# EasyEDA Pro project 眼球小板_立创文件.epro, board PCB1
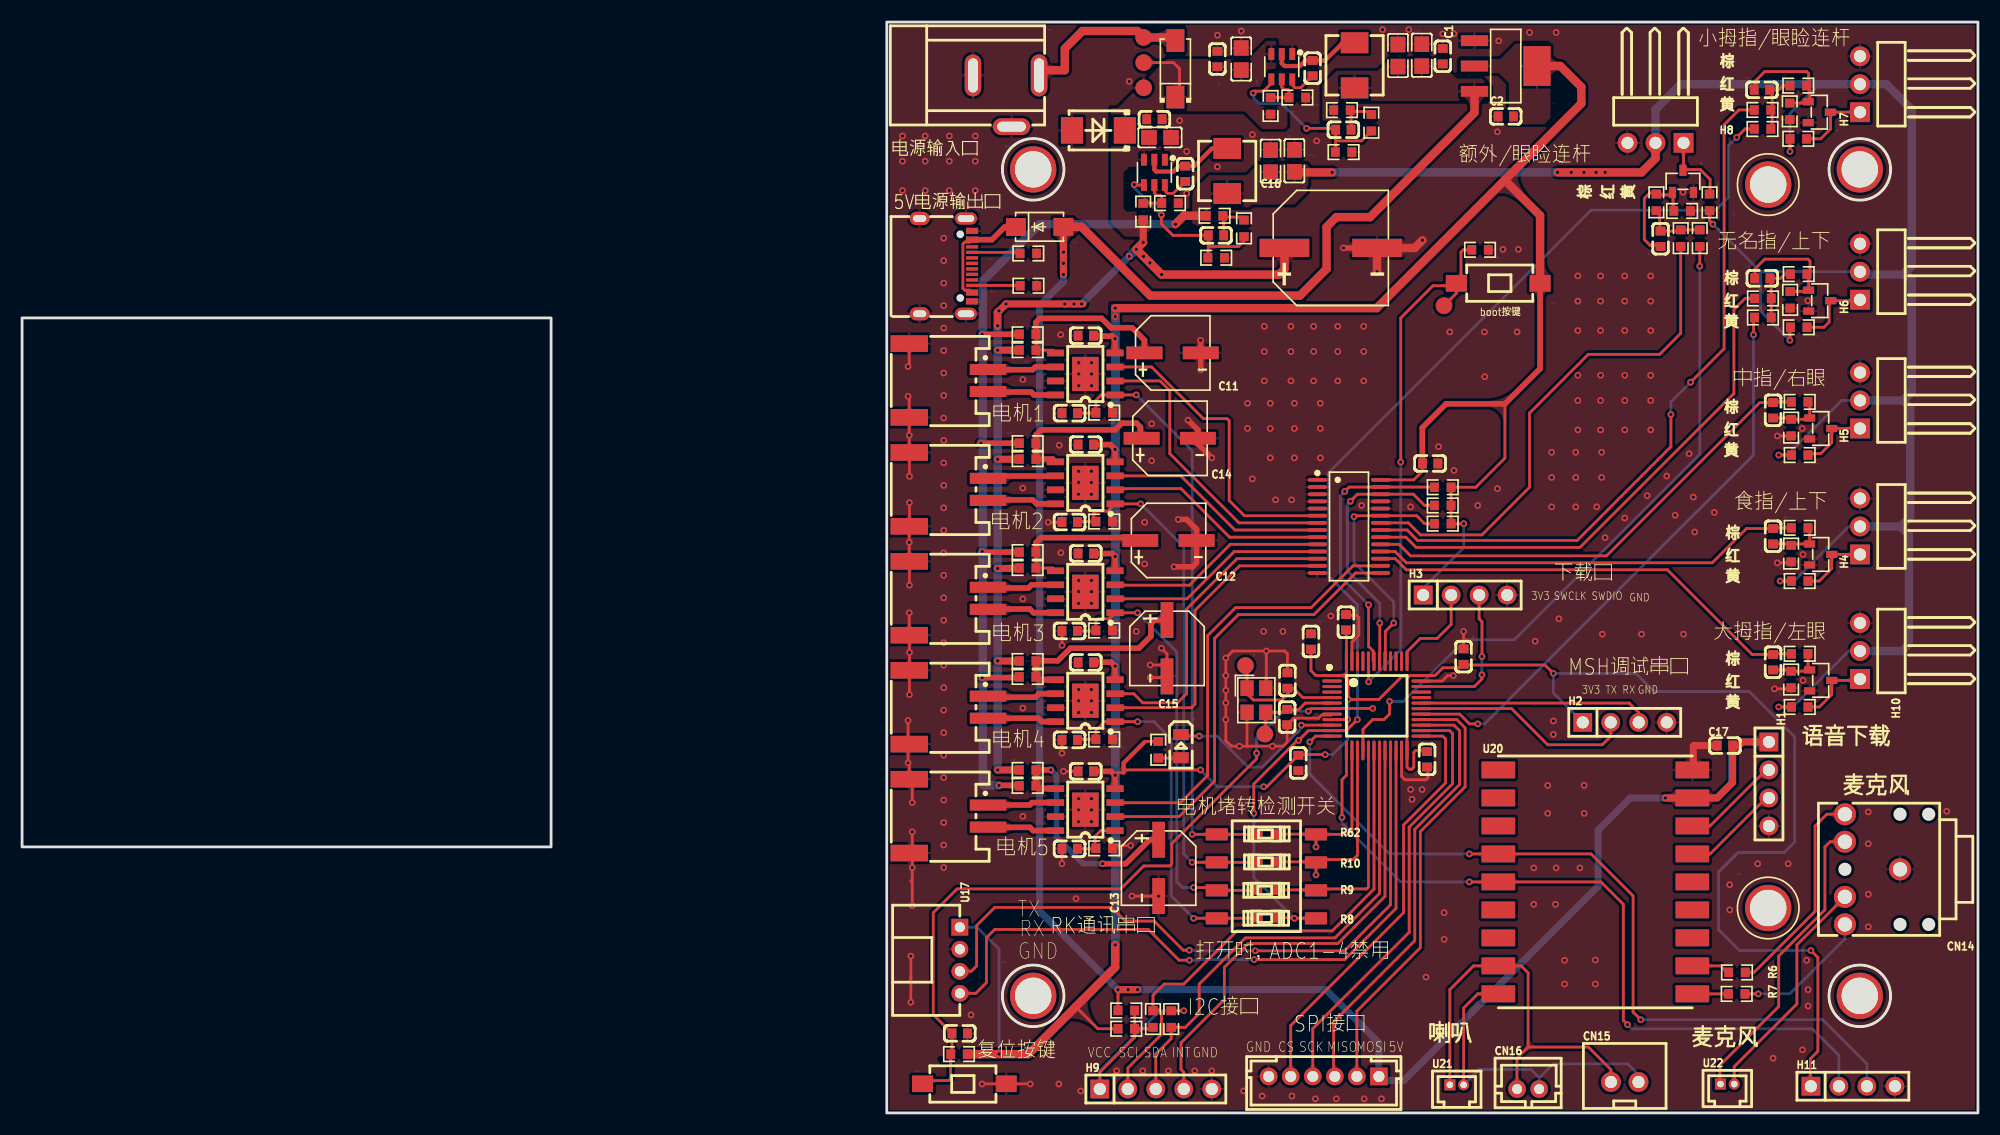
[diagram p5: board, top side]
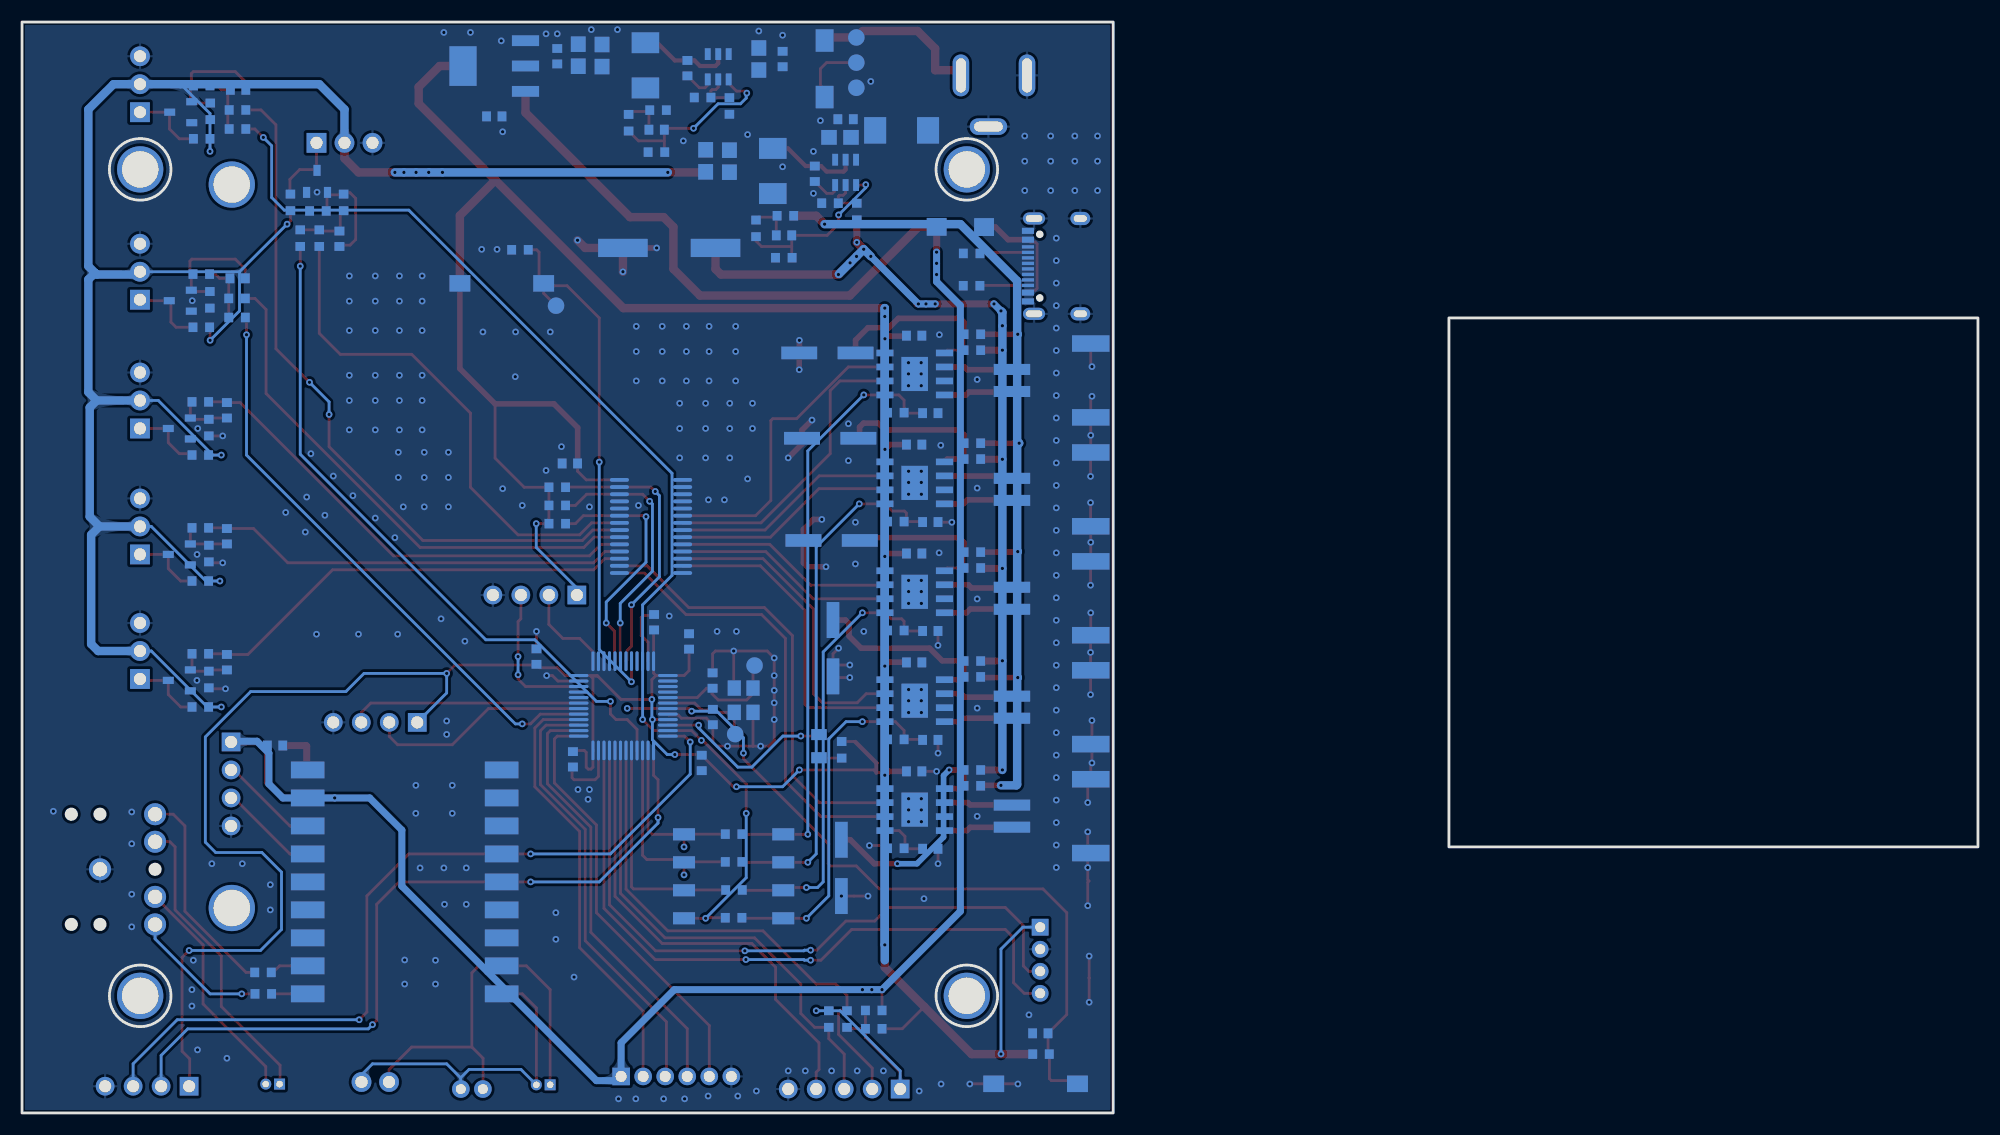
[diagram p6: board, bottom side, seen from below]

Outline 177.46 x 99 mm; copper layers: Top Layer, Bottom Layer. Coordinates in mm from the lower left corner of the outline.
Outline path: rectangle 0,72.15 48,24.15 ; rectangle 78.46,99 177.46,0 ; circle c91.74,85.63 r2.79 ; circle c91.74,10.63 r2.79 ; circle c166.74,85.63 r2.79 ; circle c166.74,10.63 r2.79
Stack: Top Layer 0.035mm / Dielectric1 1.51mm FR4 er 4.5 / Bottom Layer 0.035mm

## Design rules (mm)
spacing copperThickness1oz (default): track to track 0.102, other pairs 0.152 to 0.3
spacing copperThickness2oz: track to track 0.203, other pairs 0.152 to 0.3
track width copperThickness1oz (default): min 0.127, default 0.254, max 2.54
track width copperThickness2oz: min 0.203, default 0.254, max 2.54
differential pair differentialPair (default): width min 0.127, default 0.254, max 2.54; gap min 0.152, default 0.152
net +5V uses copperRegion
net PWM_5V uses copperRegion
net V3.3 uses copperRegion
net VIN uses copperRegion
net GND uses copperRegion

## Placement (name value [footprint] x y rotation side)
C1  10uF  [C0603_1]  128.9 95.9 270 top
C2  10uF  [C0603_1]  134.62 90.44 0 top
C3  100nF  [C0603_1]  102.74 90.18 180 top
C4  100nF  [C0603_1]  105.53 85.23 270 top
C5  100nF  [C0603]  95.05 63.51 0 top
C6  100nF  [C0603]  96.52 70.54 0 top
C7  75pF  [C0603_1]  108.33 79.64 180 top
C8  22uF  [C0805]  115.44 86.41 270 top
C9  22uF  [C0805]  113.28 86.37 270 top
C10  22uF  [C0805]  103.25 88.53 180 top
C11  100uF  [CAP-SMD_BD6.3-L6.6-W6.6-RD]  104.39 68.97 180 top
C12  100uF  [CAP-SMD_BD6.3-L6.6-W6.6-RD]  104.01 51.96 180 top
C13  100uF  [CAP-SMD_BD6.3-L6.6-W6.6-RD]  103.12 22.24 90 top
C14  100uF  [CAP-SMD_BD6.3-L6.6-W6.6-RD]  104.14 61.23 180 top
C15  100uF  [CAP-SMD_BD6.3-L6.6-W6.6-RD]  103.88 42.18 90 top
C16  470uF  [CAP-SMD_BD10.0-L10.3-W10.3-LS11.0]  118.74 78.5 0 top
C17  4.7uF  [C0603_1]  154.5 33.34 180 top
C19  100nF  [C0603]  95.05 53.62 0 top
C20  100nF  [C0603]  96.52 60.65 0 top
C21  100nF  [C0603]  95.05 43.74 0 top
C22  100nF  [C0603]  96.52 50.77 0 top
C23  100nF  [C0603]  95.05 33.86 0 top
C24  100nF  [C0603]  96.52 40.88 0 top
C25  100nF  [C0603]  95.05 23.97 0 top
C26  100nF  [C0603]  96.52 31 0 top
C27  100nF  [C0603_1]  127.48 32.09 90 top
C28  100nF  [C0603_1]  115.8 31.76 90 top
C29  100nF  [C0603_1]  116.94 42.79 270 top
C30  100nF  [C0603_1]  130.79 41.41 270 top
C31  100nF  [C0603_1]  120.12 44.53 270 top
C32  100nF  [C0603]  85.07 7.23 180 top
C33  22pF  [C0603_1]  114.81 39.24 90 top
C34  22pF  [C0603_1]  114.78 35.93 270 top
C36  100nF  [C0603]  127.76 58.94 0 top
C37  33pF  [C0603_1]  158.87 40.91 90 top
C38  33pF  [C0603_1]  158.87 52.34 90 top
C39  33pF  [C0603_1]  158.87 63.77 90 top
C40  33pF  [C0603_1]  157.9 75.74 0 top
C41  33pF  [C0603_1]  157.86 92.85 0 top
C42  33pF  [C0603_1]  148.66 79.33 90 top
C82  100nF  [C0603_1]  117.09 94.82 270 top
C83  22uF  [C0805]  110.61 95.64 270 top
C84  100nF  [C0603_1]  108.45 95.64 270 top
C87  22uF  [C0805]  124.84 95.96 270 top
C113  22uF  [C0805]  127 95.99 270 top
C114  75pF  [C0603_1]  119.89 89.23 180 top
CN1  HCZZ0383-2  [CONN-SMD_2P-P2.00_HCZZ0383-2]  84.07 46.7 270 top
CN3  HCZZ0383-2  [CONN-SMD_2P-P2.00_HCZZ0383-2]  84.07 26.94 270 top
CN4  HCZZ0383-2  [CONN-SMD_2P-P2.00_HCZZ0383-2]  84.07 56.59 270 top
CN5  HCZZ0383-2  [CONN-SMD_2P-P2.00_HCZZ0383-2]  84.07 36.82 270 top
CN11  HCZZ0383-2  [CONN-SMD_2P-P2.00_HCZZ0383-2]  84.07 66.47 270 top
CN14  PJ-307N5  [AUDIO-TH_PJ-307N5]  167.89 22.11 180 top
CN15  AXH-2A-11  [CONN-TH_KH-XH-2A-Z]  145.41 2.81 0 top
CN16  B2B-PH-K-S(LF)(SN)  [CONN-TH_B2B-PH-K-S]  136.65 2.17 0 top
D3  SMBJ36A  [SMB_L4.4-W3.6-LS5.3-RD]  97.66 89.17 180 top
D4  B260A-13-F  [SMA_L4.4-W2.8-LS5.4-RD]  104.64 94.75 90 top
D5  NCD0805G1  [LED0805-R-RD]  105.15 33.29 270 top
D6  SS34  [SMA_L4.3-W2.6-LS5.0-FD]  92.33 80.4 180 top
DC1  DC-005-A200  [DC-IN-TH_DC-005-A200]  89.28 91.83 0 top
H1  PZ254V-11-04P  [HDR-TH_4P-P2.54-V-M]  158.49 29.86 270 top
H2  PZ254V-11-04P  [HDR-TH_4P-P2.54-V-M]  145.41 35.45 0 top
H3  PZ254V-11-04P  [HDR-TH_4P-P2.54-V-M]  130.93 47 0 top
H4  PZ254R-11-03P  [HDR-TH_3P-P2.54-H-M-W10.4]  166.76 53.23 90 top
H5  PZ254R-11-03P  [HDR-TH_3P-P2.54-H-M-W10.4]  166.76 64.66 90 top
H6  PZ254R-11-03P  [HDR-TH_3P-P2.54-H-M-W10.4]  166.76 76.34 90 top
H7  PZ254R-11-03P  [HDR-TH_3P-P2.54-H-M-W10.4]  166.76 93.36 90 top
H8  PZ254R-11-03P  [HDR-TH_3P-P2.54-H-M-W10.4]  148.21 88.04 180 top
H9  PZ254V-11-05P  [HDR-TH_5P-P2.54-V-M]  102.87 2.17 0 top
H10  PZ254R-11-03P  [HDR-TH_3P-P2.54-H-M-W10.4]  166.76 41.92 90 top
H11  PZ254V-11-04P  [HDR-TH_4P-P2.54-V-M]  166.11 2.43 0 top
L1  10uH  [IND-SMD_L5.4-W5.2_FXL0530]  109.34 85.48 90 top
L9  10uH  [IND-SMD_L5.4-W5.2_FXL0530]  120.9 95.07 90 top
Q1  MMBT3904  [SOT-23-3_L2.9-W1.3-P1.90-LS2.4-BR]  163.19 39.26 180 top
Q2  MMBT3904  [SOT-23-3_L2.9-W1.3-P1.90-LS2.4-BR]  163.19 50.69 180 top
Q3  MMBT3904  [SOT-23-3_L2.9-W1.3-P1.90-LS2.4-BR]  163.19 62.12 180 top
Q4  MMBT3904  [SOT-23-3_L2.9-W1.3-P1.90-LS2.4-BR]  163.1 73.71 180 top
Q5  MMBT3904  [SOT-23-3_L2.9-W1.3-P1.90-LS2.4-BR]  163.06 90.82 180 top
Q6  MMBT3904  [SOT-23-3_L2.9-W1.3-P1.90-LS2.4-BR]  150.7 84.54 270 top
R1  100kΩ  [R0603_1]  110.87 80.28 90 top
R2  50Ω  [R0603_1]  108.2 81.42 180 top
R3  13.3kΩ  [R0603_1]  108.35 77.61 180 top
R4  511kΩ  [R0603_1]  101.72 81.8 270 top
R5  105kΩ  [R0603_1]  104.15 82.56 180 top
R6  0Ω  [R0603_1]  155.6 12.76 0 top
R7  0Ω  [R0603_1]  155.57 10.81 0 top
R8  0Ω  [R0603_1]  112.9 17.72 180 top
R9  0Ω  [R0603_1]  112.87 20.24 180 top
R10  0Ω  [R0603_1]  112.9 22.79 180 top
R11  2.1kΩ  [R0603_1]  98.19 63.55 180 top
R12  2.1kΩ  [R0603_1]  98.19 53.67 180 top
R13  2.1kΩ  [R0603_1]  98.19 43.78 180 top
R14  2.1kΩ  [R0603_1]  98.19 33.9 180 top
R15  2.1kΩ  [R0603_1]  98.19 24.02 180 top
R16  0Ω  [R0603_1]  91.24 70.66 0 top
R17  0Ω  [R0603_1]  91.24 69.22 0 top
R18  0Ω  [R0603_1]  91.24 60.78 0 top
R19  0Ω  [R0603_1]  91.24 59.34 0 top
R20  0Ω  [R0603_1]  91.24 50.9 0 top
R21  0Ω  [R0603_1]  91.24 49.45 0 top
R22  0Ω  [R0603_1]  91.24 39.57 0 top
R23  0Ω  [R0603_1]  91.24 41.01 0 top
R24  0Ω  [R0603_1]  91.24 29.69 0 top
R25  0Ω  [R0603_1]  91.24 31.13 0 top
R26  10kΩ  [R0603]  132.28 78.33 180 top
R27  10kΩ  [R0603]  85.01 5.34 180 top
R28  200Ω  [R0603_1]  103.1 32.96 90 top
R29  4.7kΩ  [R0603_1]  128.9 56.78 180 top
R30  4.7kΩ  [R0603_1]  128.9 55.13 180 top
R31  10kΩ  [R0603_1]  128.9 53.48 0 top
R32  1kΩ  [R0603_1]  161.29 41.67 0 top
R33  4.7kΩ  [R0603_1]  160.51 39.33 90 top
R34  4.7kΩ  [R0603_1]  161.29 36.84 180 top
R35  1kΩ  [R0603_1]  161.29 53.1 0 top
R36  4.7kΩ  [R0603_1]  160.51 50.77 90 top
R37  4.7kΩ  [R0603_1]  161.29 48.27 180 top
R38  1kΩ  [R0603_1]  161.29 64.53 0 top
R39  4.7kΩ  [R0603_1]  160.51 62.19 90 top
R40  4.7kΩ  [R0603_1]  161.29 59.7 180 top
R41  1kΩ  [R0603_1]  161.2 76.12 0 top
R42  4.7kΩ  [R0603_1]  160.42 73.79 90 top
R43  4.7kΩ  [R0603_1]  161.2 71.3 180 top
R44  1kΩ  [R0603_1]  161.16 93.23 0 top
R45  4.7kΩ  [R0603_1]  160.38 90.9 90 top
R46  4.7kΩ  [R0603_1]  161.16 88.41 180 top
R47  1kΩ  [R0603_1]  148.28 82.63 90 top
R48  4.7kΩ  [R0603_1]  150.62 81.86 180 top
R49  4.7kΩ  [R0603_1]  153.11 82.63 270 top
R50  0Ω  [R0603_1]  150.49 79.39 270 top
R51  0Ω  [R0603]  152.22 79.39 270 top
R52  0Ω  [R0603_1]  100.19 7.64 180 top
R53  0Ω  [R0603_1]  100.19 9.3 180 top
R54  0Ω  [R0603_1]  157.91 91.02 180 top
R55  0Ω  [R0603]  157.91 89.29 180 top
R56  0Ω  [R0603_1]  157.95 73.92 180 top
R57  0Ω  [R0603]  157.95 72.19 180 top
R58  4.7kΩ  [R0603_1]  102.61 8.52 270 top
R59  4.7kΩ  [R0603_1]  104.26 8.52 90 top
R60  5.1kΩ  [R0603_1]  91.3 78 0 top
R61  5.1kΩ  [R0603_1]  91.31 75.07 0 top
R62  0Ω  [R0603_1]  112.9 25.3 180 top
R137  511kΩ  [R0603_1]  113.28 91.39 270 top
R138  105kΩ  [R0603_1]  115.71 92.15 180 top
R139  100kΩ  [R0603_1]  122.42 89.86 90 top
R140  13.3kΩ  [R0603_1]  119.9 87.2 180 top
R141  50Ω  [R0603_1]  119.76 91.01 180 top
SW1  TS-1101-C-W  [SW-SMD_L6.0-W3.3-LS8.0]  133.94 75.28 180 top
SW2  TS-1101-C-W  [SW-SMD_L6.0-W3.3-LS8.0]  85.5 2.65 0 top
SW3  2.54-4P TPGT  [SW-SMD_8P-L10.2-W6.2-P2.54-LS9.4]  112.9 21.48 180 top
TP1  -  [Test-Point-1.5mm]  101.77 95.32 0 top
TP2  -  [Test-Point-1.5mm]  101.77 93.04 0 top
TP4  -  [Test-Point-1.5mm]  101.77 97.6 0 top
TP7  -  [Test-Point-1.5mm]  129.01 73.26 90 top
TP9  -  [Test-Point-1.5mm]  111 40.6 270 top
TP10  -  [Test-Point-1.5mm]  112.76 34.38 270 top
U1  DRV8251ADDAR  [SOPOWERPAD-8_L4.9-W3.9-P1.27-LS6.0-TL-EP]  96.47 57.18 180 top
U2  TPS54302DDCR  [SOT-23-6_L2.9-W1.6-P0.95-LS2.8-BL]  102.74 85.36 180 top
U3  DRV8251ADDAR  [SOPOWERPAD-8_L4.9-W3.9-P1.27-LS6.0-TL-EP]  96.47 47.3 180 top
U4  DRV8251ADDAR  [SOPOWERPAD-8_L4.9-W3.9-P1.27-LS6.0-TL-EP]  96.47 67.06 180 top
U5  DRV8251ADDAR  [SOPOWERPAD-8_L4.9-W3.9-P1.27-LS6.0-TL-EP]  96.47 37.41 180 top
U6  DRV8251ADDAR  [SOPOWERPAD-8_L4.9-W3.9-P1.27-LS6.0-TL-EP]  96.47 27.53 180 top
U7  GD32F103C8T6  [TQFP-48_L7.0-W7.0-P0.50-LS9.0-BL]  122.91 36.95 270 top
U8  PCA9685PW/Q900,118  [TSSOP-28_L9.7-W4.4-P0.65-LS6.4-BL]  120.39 53.23 270 top
U9  M3*12+3  [TH_BD4.7-D3.0]  158.43 84.25 90 top
U10  M3*12+3  [TH_BD4.7-D3.0]  158.43 18.6 0 top
U11  WAFER-PH2.0-6PZZ  [CONN-TH_6P-P2.00_PH2.0-6P]  118.11 3.31 0 top
U12  M3*12+3  [TH_BD4.7-D3.0]  91.74 85.63 0 top
U13  M3*12+3  [TH_BD4.7-D3.0]  166.74 85.63 0 top
U14  M3*12+3  [TH_BD4.7-D3.0]  91.74 10.63 0 top
U15  M3*12+3  [TH_BD4.7-D3.0]  166.74 10.63 0 top
U16  CJT1117B-3.3  [SOT-223-4_L6.5-W3.5-P2.30-LS7.0-BR]  134.62 95.01 180 top
U17  WAFER-PH2.0-4PWZ  [CONN-TH_4P-P2.00_BX-PH2.0-4PWZ]  85.09 13.86 270 top
U20  957dd1498d12ea03  [ASRPRO邮票孔]  142.62 20.97 0 top
U21  ZX-MX1.25-2PZZ  [CONN-TH_2P-P1.25_MEGASTAR_ZX-MX1.25-2PZZ]  130.17 2.55 0 top
U22  ZX-MX1.25-2PZZ  [CONN-TH_2P-P1.25_MEGASTAR_ZX-MX1.25-2PZZ]  154.72 2.62 0 top
U28  TPS54302DDCR  [SOT-23-6_L2.9-W1.6-P0.95-LS2.8-BL]  114.3 94.94 180 top
USB1  TYPE-C 16PIN 2MD(073)  [USB-C-SMD_TYPE-C-16PIN-2MD-073]  83.82 76.85 270 top
X1  8MHz  [CRYSTAL-SMD_4P-L3.2-W2.5-BL]  111.99 37.45 270 top

## Footprints (pads in the part's own frame, mm; a bottom-side part is the same pattern mirrored in y, then rotated)
ASRPRO邮票孔
  rect 3.048x1.524 hole 0.001: 1(-8.673,10.16) 2(-8.673,7.62) 3(-8.673,5.08) 4(-8.673,2.54) 5(-8.673,0) 6(-8.673,-2.54) 7(-8.673,-5.08) 8(-8.673,-7.62) 9(-8.673,-10.16) 10(8.927,-10.159) 11(8.927,-7.62) 12(8.927,-5.08) 13(8.927,-2.539) 14(8.927,0.001) 15(8.927,2.541) 16(8.927,5.08) 17(8.927,7.62) 18(8.927,10.161)
AUDIO-TH_PJ-307N5
  round 2 hole 1.3: 1(-2.5,0) 2(2.5,-5) 3(2.5,5) 4(2.5,-2.5) 5(2.5,2.5)
C0603
  rect 0.8x0.9 hole 0.001: 1(-0.7,0) 2(0.7,0)
C0603_1
  rect 0.8x0.9 hole 0.001: 1(-0.7,0) 2(0.7,0)
C0805
  rect 1.41x1.35 hole 0.001: 1(-1,0) 2(1,0)
CAP-SMD_BD6.3-L6.6-W6.6-RD
  rect 3.26x1.15 hole 0.001: 1(2.555,0) 2(-2.555,0)
CAP-SMD_BD10.0-L10.3-W10.3-LS11.0
  rect 4.5x1.65 hole 0.001: 1(-4.2,0) 2(4.2,0)
CONN-SMD_2P-P2.00_HCZZ0383-2
  rect 1x3.3 hole 0.001: 1(-1,3.575) 2(1,3.575)
  rect 1.5x3.4 hole 0.001: 3(3.35,-3.575) 4(-3.35,-3.575)
CONN-TH_2P-P1.25_MEGASTAR_ZX-MX1.25-2PZZ
  rect 1x1 hole 0.6: 1(-0.625,0)
  round 1 hole 0.6: 2(0.625,0)
CONN-TH_4P-P2.00_BX-PH2.0-4PWZ
  rect 1.524x1.524 hole 0.914: 1(-3,0)
  round 1.524 hole 0.914: 2(-1,0) 3(1,0) 4(3,0)
CONN-TH_6P-P2.00_PH2.0-6P
  rect 1.6x1.6 hole 1: 1(5,0)
  round 1.6 hole 1: 2(3,0) 3(1,0) 4(-1,0) 5(-3,0) 6(-5,0)
CONN-TH_B2B-PH-K-S
  round 1.6 hole 0.9: 1(1,0) 2(-1,0)
CONN-TH_KH-XH-2A-Z
  round 1.8 hole 1.1: 1(-1.25,0) 2(1.25,0)
CRYSTAL-SMD_4P-L3.2-W2.5-BL
  rect 1.4x1.2 hole 0.001: 1(-1.1,-0.85) 2(1.1,-0.85) 3(1.1,0.85) 4(-1.1,0.85)
DC-IN-TH_DC-005-A200
  oval 1.5x3.8 hole 0.9x3.1: 1(3,2.325) 2(-3,2.325)
  oval 3.4x1.5 hole 2.6x0.9: 3(0.5,-2.325)
HDR-TH_3P-P2.54-H-M-W10.4
  rect 1.8x1.8 hole 1.1: 1(-2.54,0)
  round 1.8 hole 1.1: 2(0,0) 3(2.54,0)
HDR-TH_4P-P2.54-V-M
  rect 1.7x1.7 hole 1.1: 1(-3.81,0)
  round 1.7 hole 1.1: 2(-1.27,0) 3(1.27,0) 4(3.81,0)
HDR-TH_5P-P2.54-V-M
  rect 1.7x1.7 hole 1.1: 1(-5.08,0)
  round 1.7 hole 1.1: 2(-2.54,0) 3(0,0) 4(2.54,0) 5(5.08,0)
IND-SMD_L5.4-W5.2_FXL0530
  rect 1.9x2.5 hole 0.001: 1(-2.05,0) 2(2.05,0)
LED0805-R-RD
  rect 1x1.399 hole 0.001: 1(1.05,0) 2(-1.05,0)
R0603
  rect 0.806x0.864 hole 0.001: 1(-0.753,0) 2(0.753,0)
R0603_1
  rect 0.806x0.864 hole 0.001: 1(-0.753,0) 2(0.753,0)
SMA_L4.3-W2.6-LS5.0-FD
  rect 1.8x1.62 hole 0.001: 1(-2.15,-0.009) 2(2.15,0.009)
SMA_L4.4-W2.8-LS5.4-RD
  rect 2.046x1.62 hole 0.001: 1(-2.566,0) 2(2.566,0)
SMB_L4.4-W3.6-LS5.3-RD
  rect 2x2.4 hole 0.001: 1(-2.4,0) 2(2.4,0)
SOPOWERPAD-8_L4.9-W3.9-P1.27-LS6.0-TL-EP
  rect 1.55x0.6 hole 0.001: 1(-2.7,1.905) 2(-2.7,0.635) 3(-2.7,-0.635) 4(-2.7,-1.905) 5(2.7,-1.905) 6(2.7,-0.635) 7(2.7,0.635) 8(2.7,1.905)
  rect 2.41x3.1 hole 0.001: 9(0,0)
SOT-23-3_L2.9-W1.3-P1.90-LS2.4-BR
  rect 1x0.65 hole 0.001: 1(1,-0.95) 2(1,0.95) 3(-1,0)
SOT-23-6_L2.9-W1.6-P0.95-LS2.8-BL
  rect 0.532x1.072 hole 0.001: 1(-0.95,-1.149) 2(0,-1.149) 3(0.95,-1.149) 4(0.95,1.149) 5(0,1.149) 6(-0.95,1.149)
SOT-223-4_L6.5-W3.5-P2.30-LS7.0-BR
  rect 2.47x0.98 hole 0.001: 1(2.835,-2.3) 2(2.835,0) 3(2.835,2.3)
  rect 2.47x3.6 hole 0.001: 4(-2.835,0)
SW-SMD_8P-L10.2-W6.2-P2.54-LS9.4
  rect 2x1.1 hole 0.001: 1(-4.5,3.81) 2(-4.5,1.27) 3(-4.5,-1.27) 4(-4.5,-3.81) 5(4.5,-3.81) 6(4.5,-1.27) 7(4.5,1.27) 8(4.5,3.81)
SW-SMD_L6.0-W3.3-LS8.0
  rect 1.9x1.5 hole 0.001: 1(-3.8,0) 2(3.8,0)
Test-Point-1.5mm
  round 1.5 hole 0.001: 1(0,0)
TH_BD4.7-D3.0
  round 4.2 hole 3.3: 1(0,0)
TQFP-48_L7.0-W7.0-P0.50-LS9.0-BL
  oval 0.28x1.8 hole 0.001: 1(-2.75,-4.05) 2(-2.25,-4.05) 3(-1.75,-4.05) 4(-1.25,-4.05) 5(-0.75,-4.05) 6(-0.25,-4.05) 7(0.25,-4.05) 8(0.75,-4.05) 9(1.25,-4.05) 10(1.75,-4.05) 11(2.25,-4.05) 12(2.75,-4.05) 25(2.75,4.05) 26(2.25,4.05) 27(1.75,4.05) 28(1.25,4.05) 29(0.75,4.05) 30(0.25,4.05) 31(-0.25,4.05) 32(-0.75,4.05) 33(-1.25,4.05) 34(-1.75,4.05) 35(-2.25,4.05) 36(-2.75,4.05)
  oval 1.8x0.28 hole 0.001: 13(4.05,-2.75) 14(4.05,-2.25) 15(4.05,-1.75) 16(4.05,-1.25) 17(4.05,-0.75) 18(4.05,-0.25) 19(4.05,0.25) 20(4.05,0.75) 21(4.05,1.25) 22(4.05,1.75) 23(4.05,2.25) 24(4.05,2.75) 37(-4.05,2.75) 38(-4.05,2.25) 39(-4.05,1.75) 40(-4.05,1.25) 41(-4.05,0.75) 42(-4.05,0.25) 43(-4.05,-0.25) 44(-4.05,-0.75) 45(-4.05,-1.25) 46(-4.05,-1.75) 47(-4.05,-2.25) 48(-4.05,-2.75)
TSSOP-28_L9.7-W4.4-P0.65-LS6.4-BL
  oval 0.343x1.732 hole 0.001: 1(-4.225,-2.866) 2(-3.575,-2.866) 3(-2.925,-2.866) 4(-2.275,-2.866) 5(-1.625,-2.866) 6(-0.975,-2.866) 7(-0.325,-2.866) 8(0.325,-2.866) 9(0.975,-2.866) 10(1.625,-2.866) 11(2.275,-2.866) 12(2.925,-2.866) 13(3.575,-2.866) 14(4.225,-2.866) 15(4.225,2.866) 16(3.575,2.866) 17(2.925,2.866) 18(2.275,2.866) 19(1.625,2.866) 20(0.975,2.866) 21(0.325,2.866) 22(-0.325,2.866) 23(-0.975,2.866) 24(-1.625,2.866) 25(-2.275,2.866) 26(-2.925,2.866) 27(-3.575,2.866) 28(-4.225,2.866)
USB-C-SMD_TYPE-C-16PIN-2MD-073
  oval 1.1x2 hole 0.6x1.5: 13(-4.325,1.825) 14(4.325,1.825)
  oval 1.2x1.8 hole 0.6x1.2: 13(-4.325,-2.375) 14(4.325,-2.375)
  rect 0.55x1.1 hole 0.001: A1B12(-3.2,2.375) A4B9(-2.4,2.375) B1A12(3.2,2.375) B4A9(2.4,2.375)
  rect 0.3x1.1 hole 0.001: A5(-1.25,2.375) A6(-0.25,2.375) A7(0.25,2.375) A8(1.25,2.375) B5(1.75,2.375) B6(0.75,2.375) B7(-0.75,2.375) B8(-1.75,2.375)

## Nets
As in the schematic.

Pads without a net: U7 2 3 4 32 33 38 39 40 45 46; U9 1; U10 1; U12 1; U13 1; U14 1; U15 1; U20 1 2 3 6 7 12 13 14; USB1 A6 A7 A8 B6 B7 B8

## Via types
v1: diameter 0.61, hole 0.305, Top Layer to Bottom Layer, 414 vias

## Routing (per net, layer and track width the routed paths; a pad name or vN(x,y) marks a point on that pad's centre or on a via; arc(x,y) is an arc through that point)
+5V: length 224.8
  Top Layer w0.254: R53.2 v1(99.44,11.19)
  Top Layer w0.635: H1.1 156.08,33.67 155.75,33.34 C17.1 155.2,30 153.79,28.59 U20.17 v1(149.1,28.59) ; v1(94.48,76.09) v1(94.48,77.1) v1(94.48,78.12) 94.48,78.13 D6.1 ; v1(101.22,11.19) v1(100.36,11.19) v1(99.44,11.19)
  Top Layer w0.762: D6.1 96.13,80.41 102.36,74.18 115.95,74.18 118.36,76.59 118.36,80.4 119.25,81.29 122.3,81.29 131.78,90.78 U16.3
  Bottom Layer w0.635: H1.1 158.43,33.74 156.15,33.74 155.06,32.65 155.06,29.86 153.79,28.59 v1(149.1,28.59) 145.92,28.59 143,25.67 143,20.59 125.35,2.93 123.49,2.93 U11.1 123.11,6.36 118.28,11.19 v1(101.22,11.19) v1(100.36,11.19) v1(99.44,11.19) 92.33,18.3 92.33,73.28 94.48,75.44 v1(94.48,76.09) v1(94.48,77.1) v1(94.48,78.12)
GND: length 146.3
  Top Layer w0.254: C21.1 94.36,43.74 v1(94.36,42.43) ; R33.1 160.42,38.49 v1(159,38.49) ; C27.1 127.56,31.31 127.56,30.42 127.38,30.24 125.47,30.24 125.16,30.55 U7.23 ; 103.88,40.65 103.88,41.67 v1(103.37,42.18) ; 103.88,40.65 v1(102.36,40.65) ; 103.88,40.65 C15.2 103.77,39.51 v1(102.36,39.51) ; C33.2 114.8,39.95 114.8,41.67 114.55,41.92 v1(112.89,41.92) ; v1(112.89,41.92) 109.85,41.92 v1(109.22,41.29) v1(109.22,39.69) v1(109.22,38.35) v1(109.22,37.22) v1(109.22,35.7) 109.22,33.8 109.73,33.29 v1(110.45,33.29) 111.14,33.29 ; v1(112.89,41.92) 112.89,38.61 X1.4 ; v1(80.39,67.73) 80.5,67.84 CN11.4 ; v1(80.52,47.89) 80.52,50.04 CN1.4 v1(80.5,51.79) CN4.3 80.52,53.26 v1(80.52,55.38) ; v1(80.39,65.04) 80.5,64.93 CN11.3 v1(80.5,61.5) CN4.4 80.52,59.92 v1(80.52,57.77) ; v1(80.39,35.62) 80.39,33.58 CN5.3 80.39,33.36 v1(80.39,31.76) 80.5,31.66 CN3.4 80.77,30.01 v1(80.77,28.17) ; C25.1 v1(94.35,22.62) ; U7.8 118.78,36.12 117.93,36.12 117.64,35.83 115.38,35.83 C34.2 114.78,33.65 114.42,33.29 v1(113.46,33.29) 111.14,33.29 ; v1(80.52,37.96) 80.52,40.15 CN5.4 80.52,40.19 v1(80.52,41.8) 80.52,43.34 CN1.3 v1(80.5,45.39) ; v1(91.47,2.63) 91.45,2.65 SW2.2 87.12,2.65 v1(87.11,2.63) ; C31.1 120.2,45.15 121.1,45.15 121.28,44.97 121.28,43.34 120.66,42.72 U7.47 ; v1(93.1,53.61) 94.34,53.61 C19.1 ; v1(100.58,24.27) 99.19,24.27 R15.1 ; 111.14,33.29 111.14,33.29 X1.2 ; R39.1 v1(159.25,61.44) ; U7.35 128.84,39.2 129.33,39.69 v1(129.87,39.69) ; v1(80.64,14.24) 80.64,12.26 80.65,12.25 80.64,12.24 v1(80.64,10.05) ; v1(80.77,25.51) 80.77,23.86 80.5,23.59 80.77,23.31 v1(80.77,22.27) 80.77,21.17 80.65,21.05 80.77,20.93 v1(80.77,18.81) ; C30.1 v1(130.79,43.7) ; v1(159.25,49.92) 160.42,49.92 R36.1 ; v1(100.71,19.68) v1(103.12,19.68) ; C26.1 v1(94.48,31) ; C23.1 v1(94.35,32.65)
  Top Layer w0.508: v1(104.9,53.86) 105.66,53.86 106.57,52.96 C12.2 106.57,49.92 106.21,49.56 v1(104.52,49.56) ; v1(105.79,62.88) 106.69,61.97 C14.2 106.69,60.7 v1(107.95,59.45) ; v1(106.93,70.12) 106.93,68.99 C11.2 v1(106.95,67.45) ; C16.2 v1(119.89,78.5)
  Top Layer w0.635: U20.18 151.63,31.22 151.63,33.29 151.69,33.34 C17.2
  Top Layer w0.762: v1(122.94,76.34) C16.2 126.36,78.5 v1(127.06,79.2)
  vias: v1(79.88,88.66) v1(79.88,86.37) v1(79.88,83.71) v1(81.94,88.66) v1(81.94,86.37) v1(81.94,83.71) v1(83.62,79.39) v1(83.62,77.35) v1(83.62,75.31) v1(83.62,73.27) v1(83.62,71.23) v1(83.62,69.19) v1(83.62,67.15) v1(83.62,65.11) v1(83.62,63.07) v1(83.62,61.03) v1(83.62,58.99) v1(83.62,56.95) v1(83.62,54.91) v1(83.62,52.87) v1(83.62,50.83) v1(83.62,48.79) v1(83.62,46.75) v1(83.62,44.71) v1(83.62,42.67) v1(83.62,40.63) v1(83.62,38.59) v1(83.62,36.55) v1(83.62,34.51) v1(83.62,32.47) v1(83.62,30.43) v1(83.62,28.39) v1(83.62,26.35) v1(83.62,24.31) v1(83.62,22.27) v1(84.13,88.66) v1(84.13,86.37) v1(84.13,83.71) v1(86.1,8.9) v1(86.49,88.66) v1(86.49,86.37) v1(86.49,83.71) v1(90.8,66.56) v1(90.8,56.71) v1(90.8,46.65) v1(90.8,36.74) v1(90.8,26.93) v1(94.1,60.59) v1(94.07,2.63) v1(94.23,70.62) v1(94.25,50.83) v1(95.63,19.44) v1(95.88,68.08) v1(95.88,67.07) v1(95.88,66) v1(95.87,58.23) v1(95.87,57.22) v1(95.86,56.15) v1(95.87,48.33) v1(95.87,47.31) v1(95.86,46.24) v1(95.87,38.42) v1(95.87,37.41) v1(95.86,36.33) v1(95.87,28.52) v1(95.87,27.5) v1(95.86,26.43) v1(96.06,1.99) v1(97.04,68.08) v1(97.04,67.07) v1(97.04,66) v1(97.02,58.23) v1(97.02,57.22) v1(97.02,56.15) v1(97.02,48.33) v1(97.02,47.31) v1(97.02,46.24) v1(97.02,38.42) v1(97.02,37.41) v1(97.02,36.33) v1(97.02,28.52) v1(97.02,27.5) v1(97.02,26.43) v1(99.31,3.82) v1(100.45,93.61) v1(101.09,43.7) v1(101.69,3.82) v1(101.85,53.61) v1(101.85,49.82) v1(102.49,62.55) v1(102.49,59.19) v1(104.01,3.82) v1(105.03,90.06) v1(105.66,87.26) v1(105.66,83.45) v1(106.4,3.82) v1(107.95,3.82) v1(108.45,97.8) v1(108.45,85.86) v1(110.61,98.18) v1(110.83,1.99) v1(111.19,64.4) v1(111.19,62.12) v1(111.63,88.79) v1(111.63,57.54) v1(112.52,1.54) v1(112.65,43.7) v1(112.71,71.39) v1(112.71,69.1) v1(112.71,66.43) v1(113.25,64.4) v1(113.25,62.12) v1(113.25,59.45) v1(113.74,55.64) v1(114.4,43.7) v1(115.12,71.39) v1(115.12,69.1) v1(115.12,66.43) v1(115.19,55.64) v1(115.21,1.54) v1(115.44,64.4) v1(115.44,62.12) v1(115.44,59.45) v1(117.19,71.39) v1(117.19,69.1) v1(117.19,66.43) v1(117.35,1.28) v1(117.46,88.22) v1(117.79,64.4) v1(117.79,62.12) v1(117.79,59.45) v1(118.74,45.1) v1(119.25,1.28) v1(119.38,71.39) v1(119.38,69.1) v1(119.38,66.43) v1(121.54,55.13) v1(121.73,71.39) v1(121.73,69.1) v1(121.73,66.43) v1(121.77,1.28) v1(123.34,1.28) v1(123.44,98.31) v1(125.81,98.31) v1(125.98,55) v1(125.98,29.35) v1(126.11,28.46) v1(127.02,29.35) v1(127.38,12.33) v1(128.52,60.47) v1(128.9,97.93) v1(129.03,18.17) v1(129.03,15.76) v1(129.54,70.88) v1(129.92,97.93) v1(129.92,58.31) v1(132.08,55.13) v1(132.68,70.88) v1(132.71,66.81) v1(133.86,89.04) v1(133.86,56.66) v1(133.98,97.29) v1(134.36,78.37) v1(135.65,70.88) v1(135.76,78.37) v1(136.78,98.06) v1(137.16,22.24) v1(137.16,18.94) v1(137.28,42.81) v1(138.43,29.73) v1(138.43,27.19) v1(138.78,59.96) v1(138.78,57.67) v1(138.78,55) v1(138.94,35.57) v1(138.94,34.35) v1(139.13,18.94) v1(139.19,98.06) v1(139.19,22.24) v1(139.44,44.84) v1(139.95,13.86) v1(139.95,11.7) v1(140.97,59.96) v1(140.97,57.67) v1(140.97,55) v1(141.16,75.96) v1(141.16,73.67) v1(141.16,71.01) v1(141.16,66.94) v1(141.16,64.66) v1(141.16,61.99) v1(141.35,22.24) v1(141.73,29.73) v1(141.74,27.19) v1(142.75,13.88) v1(142.75,11.7) v1(142.87,55) v1(143.22,75.96) v1(143.22,73.67) v1(143.22,71.01) v1(143.22,66.94) v1(143.22,64.66) v1(143.22,61.99) v1(143.32,59.96) v1(143.32,57.67) v1(143.38,43.45) v1(143.63,52.21) v1(145.41,75.96) v1(145.41,73.67) v1(145.41,71.01) v1(145.41,66.94) v1(145.41,64.66) v1(145.41,61.99) v1(145.41,53.99) v1(146.94,43.45) v1(147.44,56.02) v1(147.77,75.96) v1(147.77,73.67) v1(147.77,71.01) v1(147.77,66.94) v1(147.77,64.66) v1(147.77,61.99) v1(149.22,57.8) v1(149.98,54.24) v1(150.7,83.56) v1(150.75,43.45) v1(151.25,59.83) v1(151.63,55.89) v1(151.76,52.72) v1(153.54,54.5) v1(154.94,20.71) v1(154.94,18.43) v1(157.48,22.62) v1(158.87,4.97) v1(160.24,22.62) v1(161.52,62.12) v1(161.54,5.73) v1(161.58,50.69) v1(161.6,39.26) v1(161.92,13.86) v1(162.02,73.71) v1(162.05,11.19) v1(162.05,9.7) v1(167.51,27.32) v1(167.51,24.43) v1(167.51,19.85) v1(167.51,16.89) v1(174.62,27.38)
V3.3: length 442.5
  Top Layer w0.254: 115.93,32.44 116.01,32.52 v1(118.23,32.52) ; C27.2 127.38,32.9 126.45,32.9 126.28,32.73 126.28,31.38 126.1,31.2 125.84,31.2 125.66,31.38 U7.24 125.66,39.45 125.85,39.64 125.22,39.64 ; v1(120.27,35.7) 118.87,35.7 U7.9 ; v1(130.81,53.48) R31.2 R30.1 R29.1 131.9,56.78 134.54,59.42 134.54,64.35 ; R52.2 97.6,7.64 95.6,9.64 ; C29.2 116.94,40.14 117.39,39.7 U7.1 119.94,39.7 ; v1(112.65,29.6) 112.94,29.6 C28.2 ; U8.28 126.27,57.45 127.06,58.24 C36.1 ; 125.22,39.64 123.11,37.53 v1(120.32,37.53) 120.32,39.32 119.94,39.7 ; 125.22,39.64 125.28,39.7 U7.36 128.2,39.7 128.9,40.4 130.47,40.4 C30.2 130.85,40.65 138.17,40.65 v1(138.94,39.89) ; 119.94,39.7 120.16,39.92 120.16,40.99 U7.48 120.16,43.79 C31.2 ; v1(99.18,30.65) 99.41,30.87 99.95,30.87 100.2,31.13 v1(106.93,31.13) ; v1(162.3,14.75) 162.94,14.11 162.94,5.6 162.25,4.91 162.25,2.48 H11.1 ; R28.2 101.89,33.71
  Top Layer w0.381: 99.95,30.87 99.95,31.76 101.85,33.67
  Top Layer w0.508: U6.4 99.17,30.64 98.81,31 C26.2 ; U5.4 99.17,40.54 98.8,40.91 97.24,40.91 C24.2 ; U4.4 v1(99.17,70.26) 98.93,70.5 97.26,70.5 C6.2 ; C22.2 98.93,50.77 99.17,50.53 U3.4 ; C20.2 98.74,60.65 v1(99.17,60.22) U1.4 ; SW1.1 137.74,67.55 134.54,64.35 129.21,64.35 127.05,62.19 127.05,58.95 C36.1
  Top Layer w0.762: v1(99.18,73.04) 122.91,73.04 134.52,84.65 ; 85.76,5.34 91.3,5.34 99.18,13.22 v1(99.18,15.25) ; SW1.1 137.74,81.44 134.52,84.65 ; U16.4 139.57,95.01 141.48,93.1 141.48,91.61 134.52,84.65
  Bottom Layer w0.254: v1(106.93,31.13) 108.45,29.6 v1(112.65,29.6) ; H3.1 127.12,47.64 130.81,51.32 v1(130.81,53.48) ; v1(118.23,32.52) 118.92,32.52 120.27,33.87 v1(120.27,35.7) 120.32,35.75 v1(120.32,37.53) ; v1(88.64,5.35) 88.64,14.87 86.66,16.86 U17.1 ; H2.1 138.94,38.11 v1(138.94,39.89) 146.43,39.89 148.08,38.24 156.71,38.24 160.83,34.12 160.83,24.58 159.89,23.63 155.7,23.63 153.92,21.86 153.92,16.65 155.83,14.75 v1(162.3,14.75)
  Bottom Layer w0.762: v1(99.18,15.25) v1(99.18,30.65) v1(99.18,40.55) v1(99.18,50.5) v1(99.18,72.28) v1(99.18,73.04) 99.19,73.03 99.19,15.26 v1(99.18,15.25) ; v1(99.18,15.25) 99.18,13.86
VBUS: length 10.5
  Top Layer w0.254: USB1.A4B9 85.97,79.03 85.53,79.03 85.36,78.86 85.36,74.83 85.53,74.67 85.97,74.67 USB1.B4A9
  Top Layer w0.508: D6.2 89.14,80.39 87.99,79.25 USB1.A4B9
VIN: length 99.2
  Top Layer w0.254: TP1.1 104.46,95.32 105.03,94.75 105.03,93.23 104.64,92.85 D4.1
  Top Layer w0.635: 96.26,73.42 v1(95.45,73.42) v1(94.61,73.42) v1(89.28,73.42) v1(88.64,72.78) 88.49,72.63 88.49,71.36 ; v1(88.52,59.32) 90.47,59.32 R19.1 ; R23.1 88.54,41.01 v1(88.52,41.03) ; R25.1 v1(88.52,31.13) ; R4.2 v1(101.72,79.01) ; v1(88.52,49.42) 90.45,49.42 R21.1 ; R17.1 v1(88.52,69.22)
  Top Layer w0.762: v1(101.72,79.01) v1(101.1,78.38) v1(101.75,77.73) v1(102.33,77.14) v1(103.39,76.09) 114.04,76.09 114.54,76.58 C16.1
  Bottom Layer w0.635: v1(94.61,73.42) v1(95.45,73.42) v1(96.14,73.42) v1(100.45,77.74) ; v1(88.64,72.78) 89.29,73.43
  Bottom Layer w0.762: 103.35,76.13 v1(102.33,77.14) v1(101.75,77.73) v1(101.1,78.38) v1(100.45,77.74) ; v1(88.64,72.78) 88.52,72.66 v1(88.52,71.44) v1(88.52,69.22) v1(88.52,59.32) v1(88.52,49.42) v1(88.52,41.03) v1(88.52,31.13)
ADC2: length 21.1
  Top Layer w0.254: R9.1 117.37,20.24 SW3.2 117.53,20.33 121.98,20.33 122.16,20.51 U7.17
ADC3: length 18.4
  Top Layer w0.254: U7.15 121.16,23.39 120.77,23 117.65,23 SW3.3 ; SW3.3 v1(117.4,21.6) ; SW3.3 117.36,22.79 R10.1
ADC4: length 15.5
  Top Layer w0.254: U7.14 120.66,25.68 120.27,25.29 SW3.4 ; R62.1 117.38,25.3 SW3.4 ; SW3.4 v1(117.4,24.14)
ASRPRO0_RX: length 9.1
  Top Layer w0.254: H1.3 158.24,28.59 153.16,23.51 U20.15
ASRPRO0_TX: length 9.1
  Top Layer w0.254: U20.16 153.16,26.05 158.24,31.13 H1.2
BOOT0: length 49
  Top Layer w0.254: SW1.2 130.14,74.38 TP7.1 ; SW1.2 130.55,75.7 130.55,78.12 130.76,78.33 R26.2 ; SW1.2 129.92,75.07 128.01,75.07 125.09,72.15 v1(125.09,59.07) ; v1(122.17,39.13) 122.17,40.99 U7.44
  Bottom Layer w0.254: v1(125.09,59.07) 125.09,42.05 v1(122.17,39.13)
FB1: length 16.9
  Top Layer w0.254: 113.35,93.79 113.35,93.44 112.64,92.73 111.88,92.73 v1(111.7,92.55) ; 119.4,88.22 121.53,88.22 R139.1 ; v1(116.54,89.36) 119.06,89.36 C114.2 119.18,87.23 R140.2
  Bottom Layer w0.254: v1(116.54,89.36) 114.31,91.58 112.27,91.58 111.76,92.1 111.76,92.5 v1(111.7,92.55)
FB2: length 16
  Top Layer w0.254: R3.2 107.63,77.65 107.63,78.63 ; U2.4 100.95,84.21 v1(100.91,84.24) ; 107.63,78.63 110.36,78.63 110.87,79.13 R1.1 ; 107.63,78.63 C7.2 104.41,79.64 103.37,80.68 v1(103.37,81.5)
  Bottom Layer w0.254: v1(103.37,81.5) 100.91,83.96 v1(100.91,84.24)
INT: length 43.3
  Top Layer w0.254: U7.20 123.66,19.67 119.38,15.38 111.25,15.38 109.09,13.22 109.09,10.3 105.15,6.36 105.15,3.95 105.41,3.7 H9.4
M1_OUT1: length 6.2
  Top Layer w0.508: CN11.1 87.67,67.45 91.69,67.45 91.94,67.7 U4.6
M1_OUT2: length 6.3
  Top Layer w0.508: CN11.2 87.7,65.42 91.56,65.42 91.82,65.16 U4.8
M2_OUT1: length 6.2
  Top Layer w0.508: U1.6 93.75,57.8 87.86,57.8 CN4.1
M2_OUT2: length 6.3
  Top Layer w0.508: U1.8 92.05,55.27 91.69,55.64 87.7,55.64 CN4.2
M3_OUT1: length 6.3
  Top Layer w0.508: U3.6 91.6,47.93 91.31,47.64 87.71,47.64 CN1.1
M3_OUT2: length 6.3
  Top Layer w0.508: CN1.2 87.67,45.73 91.44,45.73 91.78,45.39 U3.8
M4_OUT1: length 6.3
  Top Layer w0.508: U5.6 92.26,38.05 91.95,37.73 87.73,37.73 CN5.1
M4_OUT2: length 6.3
  Top Layer w0.508: U5.8 92.52,35.51 92.2,35.83 87.65,35.83 CN5.2
M5_OUT1: length 6.2
  Top Layer w0.508: 93.77,28.16 91.65,28.16 91.44,27.95 87.66,27.95 CN3.1
M5_OUT2: length 6.3
  Top Layer w0.508: U6.8 91.73,25.62 91.44,25.92 87.66,25.92 CN3.2
MIC1+: length 27.5
  Top Layer w0.254: CN14.4 164.04,24.61 163.57,24.14 163.57,18.43 159.38,14.24 159.38,9.66 154.05,4.33 154.05,2.67 U22.1
MIC1-: length 21.1
  Top Layer w0.254: CN14.5 161.03,15.25 161.03,9.89 155.35,4.2 U22.2
MIC+: length 19.5
  Top Layer w0.254: CN14.2 163.75,27.11 162.68,26.05 162.68,18.3 157.14,12.76 R6.2
MIC-: length 12.4
  Top Layer w0.254: R7.2 v1(157.53,10.81)
  Bottom Layer w0.254: v1(157.53,10.81) 160.4,10.81 165.39,15.8 165.39,17.07
MOTOR1_ADC: length 54.6
  Top Layer w0.254: C5.2 97.39,63.51 R11.2 97.43,64.68 97.91,65.16 U4.1 101.08,65.16 v1(101.09,65.16) ; R62.2 112.13,25.29 SW3.5 v1(106.17,25.29)
  Bottom Layer w0.254: v1(106.17,25.29) 106.17,60.08 v1(101.09,65.16)
MOTOR2_ADC: length 47.6
  Top Layer w0.254: v1(101.5,55.27) U1.1 98.52,54.62 97.41,54.62 97.23,54.44 97.23,53.87 R12.2 95.8,53.67 C19.2 ; v1(106.17,22.75) SW3.6 112.11,22.75 R10.2
  Bottom Layer w0.254: v1(106.17,22.75) 105.41,23.51 105.41,51.36 v1(101.5,55.27)
MOTOR3_ADC: length 40.2
  Top Layer w0.254: v1(101.22,45.39) U3.1 98.62,44.84 97.66,44.84 97.43,44.62 R13.2 97.39,43.74 C21.2 ; v1(106.3,20.46) 108.15,20.46 SW3.7 112.08,20.21 R9.2
  Bottom Layer w0.254: v1(106.3,20.46) 105.28,20.46 104.77,20.97 104.77,41.83 v1(101.22,45.39)
MOTOR4_ADC: length 33.3
  Top Layer w0.254: R8.2 112.1,17.67 SW3.8 v1(106.3,17.67) ; v1(101.22,35.51) U5.1 98.23,35.51 97.43,34.71 R14.2 95.8,33.9 C23.2
  Bottom Layer w0.254: v1(106.3,17.67) 104.26,19.7 104.26,33.94 102.7,35.51 v1(101.22,35.51)
MOTOR5_ADC: length 4.9
  Top Layer w0.254: C25.2 97.39,23.97 R15.2 97.35,24.09 97.35,25.11 97.87,25.62 U6.1
MT1_IN1: length 28.2
  Top Layer w0.254: U8.6 110.91,54.2 109.52,55.59 109.52,62.83 109.34,63 107.18,63 102.49,67.7 U4.3
MT1_IN2: length 27
  Top Layer w0.254: U8.7 110.42,53.55 104.14,59.83 104.14,65.55 103.26,66.43 U4.2
MT2_IN1: length 20.4
  Top Layer w0.254: U8.8 110.05,52.9 105.14,57.81 U1.3
MT2_IN2: length 20.2
  Top Layer w0.254: U8.9 109.56,52.25 105.15,56.66 99.28,56.66 99.17,56.55
MT3_IN1: length 19.9
  Top Layer w0.254: U3.3 99.21,47.89 105.92,47.89 109.62,51.6 U8.10
MT3_IN2: length 20.1
  Top Layer w0.254: U8.11 117.52,50.94 109.98,50.94 105.7,46.66 99.17,46.66
MT4_IN1: length 28.6
  Top Layer w0.254: U8.12 110.23,50.3 105.66,45.73 105.66,38.05 104.84,37.22 101.69,37.22 100.87,38.05 U5.3
MT4_IN2: length 28.7
  Top Layer w0.254: U8.13 110.47,49.65 106.42,45.61 106.42,37.1 106.1,36.78 99.17,36.78
MT5_IN1: length 40.4
  Top Layer w0.254: 99.17,28.16 99.18,28.15 105.1,28.15 107.57,30.62 107.57,43.32 110.11,45.86 116.96,45.86 120.76,49.65 U8.16
MT5_IN2: length 40.8
  Top Layer w0.254: U8.15 120.99,49 117.22,45.22 110.36,45.22 108.2,43.07 108.2,30.11 104.98,26.89 U6.2
NRST: length 68.4
  Top Layer w0.254: SW2.1 81.99,2.93 84.07,2.93 84.25,3.11 84.25,5.33 R27.2 84.37,5.45 C32.2 82.67,8.93 82.67,18.17 84.83,20.33 99.69,20.33 101.77,22.42 104.14,22.42 104.32,22.6 104.32,24.35 104.27,24.4 112.01,32.14 112.01,32.52 ; v1(116.71,36.46) 116.94,36.7 U7.7 118.88,36.72 v1(122.55,36.72)
  Bottom Layer w0.254: v1(116.71,36.46) 114.42,36.46 112.01,34.05 112.01,32.52
  vias: v1(112.01,32.65)
PCA_OE: length 22.6
  Top Layer w0.254: v1(124.46,44.46) 123.7,43.7 123.7,41.03 U7.41 ; v1(120.85,54.11) 120.94,54.2 U8.23 126.53,54.2 127.25,53.48 R31.1
  Bottom Layer w0.254: v1(124.46,44.46) 124.46,46.37 120.85,49.97 v1(120.85,54.11)
PCA_SCL: length 24.2
  Top Layer w0.254: v1(120.52,55.51) 121.15,56.15 123.25,56.15 U8.26 126.23,56.15 127.25,55.13 R30.2 ; v1(123.19,44.46) 123.19,41.02 U7.42
  Bottom Layer w0.254: v1(123.19,44.46) 123.19,46.24 120.27,49.16 120.27,55.26 v1(120.52,55.51)
PCA_SDA: length 25.1
  Top Layer w0.254: U7.43 122.58,41.08 122.58,41.93 122.17,42.34 v1(122.17,46.11) ; v1(120.01,56.4) 120.41,56.8 U8.27 128.13,56.8 R29.2
  Bottom Layer w0.254: v1(120.01,56.4) 119.63,56.02 119.63,48.65 v1(122.17,46.11)
PWM1: length 6.5
  Top Layer w0.254: R34.1 163.06,36.84 164.19,37.97 Q1.3 166.63,39.26 H10.1
PWM2: length 6.5
  Top Layer w0.254: R37.1 163.06,48.27 164.19,49.4 Q2.3 H4.1
PWM3: length 6.5
  Top Layer w0.254: H5.1 Q3.3 164.19,60.83 163.19,59.83 162.17,59.83 R40.1
PWM4: length 6.9
  Top Layer w0.254: R43.1 163.49,71.3 163.95,71.77 163.95,73.56 Q4.3 166.67,73.71 H6.1
PWM5: length 6.8
  Top Layer w0.254: H7.1 Q5.3 164.08,90.8 164.08,89.29 163.19,88.41 R46.1
PWM6: length 6.7
  Top Layer w0.254: 150.75,85.61 152.27,85.61 153.16,84.72 153.16,83.32 ; 150.75,85.61 H8.1 ; 150.75,85.61 150.75,85.59 Q6.3
PWM_5V: length 284.6
  Top Layer w0.254: R34.2 v1(159.38,36.84) ; v1(153.41,80.66) 153.11,80.96 R49.2 ; R40.2 v1(159.38,59.7) ; v1(160.4,70.12) 160.4,71.25 R43.2 ; R46.2 v1(160.41,87.26) ; R37.2 v1(159.51,48.27)
  Top Layer w0.508: v1(87.12,39.51) 90.42,39.51 R22.1 ; R18.1 v1(86.99,60.78) ; R16.1 v1(87.12,70.66) ; v1(88.64,29.73) 90.44,29.73 R24.1 ; v1(87.12,50.94) 87.16,50.9 R20.1
  Top Layer w0.762: C8.2 115.49,85.36 v1(118.87,85.36) ; v1(104.64,80.66) 105.41,81.42 R2.2 ; H8.2 148.21,86.63 146.94,85.36 v1(143.63,85.36) v1(142.81,85.36) v1(141.71,85.36) v1(140.56,85.36) v1(139.32,85.36)
  Bottom Layer w0.254: v1(159.51,48.27) 160.78,48.27 165.73,53.23 H4.2 ; v1(160.41,87.26) 160.41,90.7 163.06,93.36 ; 157.73,76.34 157.73,72.78 v1(160.4,70.12) ; 157.73,76.34 v1(153.41,80.66) ; 157.73,76.34 H6.2 ; H5.2 165.1,64.66 160.14,59.7 v1(159.38,59.7) ; H10.2 165.73,41.92 160.65,36.84 v1(159.38,36.84)
  Bottom Layer w0.762: 170.43,53.23 171.19,52.46 171.19,42.56 170.56,41.92 H10.2 ; 170.43,53.23 171.32,54.11 171.32,64.02 170.69,64.66 ; 170.43,53.23 H4.2 ; 170.84,76.24 171.45,75.63 171.45,65.42 170.69,64.66 ; 170.84,76.24 170.69,76.09 167.01,76.09 H6.2 ; 170.84,76.24 171.45,76.85 171.45,91.07 169.16,93.36 H7.2 150.49,93.36 148.21,91.07 H8.2 ; v1(104.64,80.66) 92.33,80.66 87.17,75.51 87.17,70.72 v1(87.12,70.66) 87.17,70.61 87.17,60.96 v1(86.99,60.78) 87.17,60.6 87.17,51 v1(87.12,50.94) 87.17,50.88 87.17,39.57 v1(87.12,39.51) 87.17,39.45 87.17,29.8 87.25,29.73 v1(88.64,29.73) ; 170.69,64.66 H5.2 ; v1(118.87,85.36) v1(139.32,85.36) v1(140.56,85.36) v1(141.71,85.36) v1(142.81,85.36) v1(143.63,85.36)
RK_RX1: length 61.8
  Top Layer w0.254: U17.4 86.53,10.86 87.5,11.82 87.5,15.9 88.25,16.65 102.19,16.65 104.98,13.86 v1(105.92,13.86) ; U7.22 124.66,18.57 120.01,13.92 v1(111.79,13.92)
  Bottom Layer w0.254: v1(105.92,13.86) 106.47,13.86 106.53,13.92 v1(111.79,13.92)
RK_TX1: length 61
  Top Layer w0.254: v1(111.88,14.71) 119.98,14.71 124.16,18.9 U7.21 ; U17.3 86.12,12.86 86.61,13.35 86.61,17.01 88.25,18.65 98.86,18.65 100.1,17.41 102.71,17.41 105.36,14.77 v1(105.92,14.77)
  Bottom Layer w0.254: v1(105.92,14.77) 106.47,14.77 106.53,14.71 v1(111.88,14.71)
SCL: length 47.1
  Top Layer w0.254: H9.2 100.33,4.08 103.37,7.12 103.37,9.16 103.2,9.34 102.67,9.34 R58.1 102.61,10.68 103.63,11.7 105.41,11.7 110.23,16.52 118.87,16.52 122.66,20.32 U7.18
SDA: length 44.6
  Top Layer w0.254: U7.19 123.16,19.93 119.12,15.89 110.99,15.89 106.8,11.7 106.8,9.03 105.54,7.77 R59.1 104.26,6.74 102.87,5.35 H9.3
SIG_PWM1: length 40.9
  Top Layer w0.254: R32.1 158.94,41.67 C37.2 156.97,41.61 149.29,49.29 125.6,49.29 124.59,50.3 U8.17
SIG_PWM2: length 39
  Top Layer w0.254: R35.1 158.94,53.1 C38.2 156.46,53.04 153.35,49.92 125.6,49.92 124.57,50.95 U8.18
SIG_PWM3: length 43.5
  Top Layer w0.254: U8.19 124.94,51.6 125.98,50.56 143.76,50.56 157.67,64.47 C39.2 158.94,64.53 R38.1
SIG_PWM4: length 48.1
  Top Layer w0.254: R56.2 156.32,73.92 155.32,72.91 155.32,65.29 141.35,51.32 126.49,51.32 125.56,52.25 U8.20
SIG_PWM5: length 64.9
  Top Layer w0.254: v1(151.38,66.31) 154.43,69.36 154.43,89.67 155.78,91.02 157.29,91.02 ; U8.21 125.67,52.9 126.62,51.96 141.1,51.96 143.9,54.76 143.9,54.77 149.6,60.47 v1(149.6,63.39)
  Bottom Layer w0.254: v1(149.6,63.39) 149.6,64.53 v1(151.38,66.31)
SIG_PWM6: length 47.1
  Top Layer w0.254: U8.22 125.78,53.55 126.87,52.46 132.46,52.46 136.78,56.78 136.78,63.51 142.11,68.85 148.59,68.85 150.49,70.75 R50.2
SPI1_CS: length 38.7
  Top Layer w0.254: U11.5 115.11,7.94 125.35,18.17 125.35,26.14 129.16,29.95 129.16,33.94 128.9,34.2 U7.25
SPI1_MISO: length 39.8
  Top Layer w0.254: U7.27 129.91,35.2 130.43,34.68 130.43,29.8 126.36,25.74 126.36,15.63 119,8.27 119,3.43 U11.3
SPI1_MOSI: length 40
  Top Layer w0.254: U11.2 121.11,9.24 126.87,15 126.87,25.54 130.93,29.6 130.93,34.94 130.18,35.7 U7.28
SPI1_SCK: length 39.3
  Top Layer w0.254: U7.26 129.52,34.7 129.79,34.43 129.79,29.88 125.85,25.94 125.85,16.4 117.11,7.65 U11.4
SPK+: length 30
  Top Layer w0.254: U20.9 132.08,10.81 130.8,9.53 U21.2
  Bottom Layer w0.254: 137.67,3.19 138.94,4.46 145.67,4.46 146.66,3.46 CN15.2 ; 137.67,3.19 137.67,2.19 CN16.1 ; 137.67,3.19 136.9,3.95 132.19,3.95 U21.2
SPK-: length 37.4
  Top Layer w0.254: CN15.1 144.16,3.93 142.11,5.98 136.65,5.98 ; 136.65,5.98 136.65,12.71 136.01,13.35 U20.8 131.7,13.35 129.55,11.2 U21.1 ; 136.65,5.98 135.63,4.97 135.63,2.19 CN16.2
SWCLK: length 8.6
  Top Layer w0.254: U7.37 125.66,41.86 126.87,43.07 128.39,43.07 129.66,44.34 H3.2
SWDIO: length 13.5
  Top Layer w0.254: U7.34 131.77,38.7 132.46,39.38 v1(132.46,39.76) ; v1(132.46,41.41) 132.46,44.59 132.2,44.84 H3.3
  Bottom Layer w0.254: v1(132.46,39.76) v1(132.46,41.41)
TIMER0_CH0: length 53.1
  Top Layer w0.254: v1(157.1,70.62) 157.1,72.09 R57.2 ; U7.29 130.44,36.2 131.33,35.31 v1(132.08,35.31)
  Bottom Layer w0.254: v1(157.1,70.62) 157.1,59.7 132.7,35.31 v1(132.08,35.31)
TIMER1_CH1/ADC1: length 107.3
  Top Layer w0.254: 157.29,89.29 156.33,89.29 v1(155.57,88.53) ; R8.1 115.39,17.72 v1(115.44,17.67) SW3.1 ; v1(121.15,35.7) 120.15,34.7 U7.11 116.71,34.7 v1(115.82,33.81) 115.71,33.81 111.76,29.86 v1(111.76,27.19)
  Bottom Layer w0.254: v1(121.15,35.7) 121.15,46.11 118.49,48.78 118.49,58.05 142.36,81.93 153.67,81.93 154.81,83.07 154.81,87.77 v1(155.57,88.53) ; v1(111.76,27.19) 111.76,21.35 v1(115.44,17.67)
TIMER2_CH0/ADC5: length 62.3
  Top Layer w0.254: R51.2 v1(152.22,76.85) ; U7.16 121.66,34.81 122.56,35.7 122.56,35.7 123.57,35.7 124.08,36.21 v1(124.08,37.35)
  Bottom Layer w0.254: v1(152.22,76.85) 152.22,59.78 135.38,42.94 130.93,42.94 125.35,37.35 v1(124.08,37.35)
USART0_RX: length 21
  Top Layer w0.254: U7.31 145.82,37.2 146.68,36.33 H2.3
USART0_TX: length 20.1
  Top Layer w0.254: U7.30 135.14,36.7 138.43,33.41 143.38,33.41 144.14,34.18 H2.2
USART1_RX: length 74.8
  Top Layer w0.254: v1(146.87,8.46) 146.17,9.16 146.17,19.7 142.36,23.51 U20.4 v1(131.31,23.51) ; U7.12 117.36,34.2 v1(116.84,33.67)
  Bottom Layer w0.254: v1(131.31,23.51) 124.08,23.51 116.84,30.75 v1(116.84,33.67) ; v1(146.87,8.46) 163.38,8.46 167.38,4.46 H11.3
USART1_TX: length 69.5
  Top Layer w0.254: U7.13 120.16,30.64 119.76,30.24 v1(119.76,26.81) ; v1(131.31,20.97) U20.5 143.25,20.97 145.29,18.94 145.29,8.4 v1(145.67,8.01)
  Bottom Layer w0.254: H11.2 164.84,5.22 162.43,7.63 146.05,7.63 v1(145.67,8.01) ; v1(131.31,20.97) 125.09,20.97 119.76,26.3 v1(119.76,26.81)
WK_LED: length 16.4
  Top Layer w0.254: U7.10 118.86,35.19 v1(116.08,35.19) ; 105.38,34.21 v1(106.8,34.21)
  Bottom Layer w0.254: v1(116.08,35.19) 116.08,34.94 112.52,31.38 111.25,31.38 108.43,34.21 v1(106.8,34.21)
$1N40: length 15.5
  Top Layer w0.762: D4.2 104.37,97.6 TP4.1 101.18,98.18 96.2,98.18 94.61,96.59 94.61,94.63 92.75,94.63 DC1.1
$1N85: length 4.4
  Top Layer w0.254: R60.1 90.45,78.1 USB1.A5
$1N86: length 4.4
  Top Layer w0.254: USB1.B5 90.53,75.1 R61.1
$1N93: length 3.8
  Top Layer w0.254: R137.1 114.95,92.14 R138.2 114.96,92.76 114.85,92.87 114.51,92.87 114.3,93.08 U28.5
$1N94: length 3.8
  Top Layer w0.254: R139.2 122.16,90.88 120.64,90.88 120.58,90.93 ; R141.1 120.58,90.93 ; 120.58,90.93 C114.1
$1N99: length 2.9
  Top Layer w0.254: U28.6 115.31,93.73 115.31,93.22 115.49,93.04 116.01,93.04 C82.2
$1N101: length 8.4
  Top Layer w0.381: C82.1 118.23,95.52 119.84,97.12 L9.2 ; U28.2 114.3,95.26 114.55,95.01 115.95,95.01 116.46,95.52 117.09,95.52
$1N106: length 3.8
  Top Layer w0.254: R4.1 101.73,82.56 R5.2 103.4,83.17 103.29,83.28 102.96,83.28 102.74,83.5 U2.5
$1N107: length 3.8
  Top Layer w0.254: 109.03,81.35 109.08,81.29 110.61,81.29 R1.2 ; 109.03,81.35 C7.1 ; 109.03,81.35 R2.1
$1N112: length 2.9
  Top Layer w0.254: U2.6 103.76,84.14 103.76,83.63 103.94,83.45 104.46,83.45 C4.2
$1N114: length 8.4
  Top Layer w0.381: L1.2 107.96,87.53 106.36,85.93 C4.1 104.96,85.93 104.47,85.43 102.92,85.43 102.74,85.61 U2.2
$2N9: length 16.4
  Top Layer w0.254: 91.99,70.66 91.99,69.22 93.52,69.22 U4.5
  Top Layer w0.508: 91.99,70.66 91.99,71.75 92.35,72.11 97.95,72.11 98.8,71.26 100.71,71.26 101.84,70.13 C11.1
$2N20: length 15.2
  Top Layer w0.508: U1.5 93.52,59.34 91.99,59.34 91.99,61.53 92.45,61.99 99.18,61.99 99.8,62.6 101.11,62.6 101.47,62.24 101.47,61.34 C14.1
$2N64: length 13.9
  Top Layer w0.254: U3.5 93.52,49.45 91.99,49.45 91.99,50.9
  Top Layer w0.508: C12.1 101.2,52.21 92.45,52.21 91.99,51.75 91.99,50.9
$2N67: length 17.4
  Top Layer w0.508: U5.5 92.25,39.32 91.99,39.57 91.99,41.01 92.01,41.03 93.98,41.03 95.12,42.18 101.33,42.18 102.42,43.27 102.42,44.4 102.76,44.73 C15.1
$2N70: length 22.2
  Top Layer w0.508: v1(93.34,31.13) 91.99,31.13 91.99,29.69 92.25,29.43 U6.5 ; C13.1 102.31,24.79 100.14,22.62 v1(98.04,22.62)
  Bottom Layer w0.508: v1(93.34,31.13) 93.85,30.62 93.85,25.03 96.26,22.62 v1(98.04,22.62)
$2N99: length 4.9
  Top Layer w0.254: C37.1 160.39,40.21 R33.2 162.07,40.09 Q1.1 162.04,40.36 R32.2
$2N108: length 4.9
  Top Layer w0.254: R35.2 162.19,52.95 Q2.1 160.63,51.64 R36.2 160.39,51.64 C38.1
$2N113: length 4.9
  Top Layer w0.254: C39.1 160.39,63.07 R39.2 162.07,62.95 Q3.1 162.19,64.38 R38.2
$2N117: length 5.6
  Top Layer w0.254: R41.1 159.93,76.12 159.55,75.74 C40.2 158.71,75.63 R56.1 R57.1
$2N118: length 10.9
  Top Layer w0.254: C40.1 157.22,75.77 157.22,76.59 158.11,77.48 162.05,77.48 162.23,77.3 162.23,76.4 R41.2 162.1,75.97 Q4.1 161.99,74.54 R42.2
$2N122: length 5.6
  Top Layer w0.254: 160.53,93.23 159.76,93.23 159.38,92.85 158.69,92.85 158.79,92.74 158.79,89.29
$2N123: length 10.4
  Top Layer w0.254: 160.51,91.65 162.07,91.65 162.19,91.77 162.19,93.08 162.04,93.23 162.1,93.29 162.1,94.32 161.92,94.5 158.11,94.5 157.29,93.67 157.29,92.85
$2N127: length 5.4
  Top Layer w0.254: 148.59,80.09 148.59,81.56 148.33,81.81 ; C42.2 150.38,80.03 R50.1 R51.1
$2N128: length 10.1
  Top Layer w0.254: R47.2 148.17,83.5 147.7,83.5 147.19,83 147.19,79.26 147.7,78.75 148.54,78.75 C42.1 ; 148.33,83.32 149.64,83.32 149.8,83.47 149.8,81.9 149.91,81.78
$3N48: length 8.4
  Top Layer w0.254: TP10.1 112.84,34.46 X1.3 114.51,36.35 C34.1 114.83,36.59 115.82,36.59 116.43,37.2 U7.6
$3N49: length 11.7
  Top Layer w0.254: U7.5 116.2,37.7 115.36,38.54 C33.1 114.86,38.49 114.86,38.04 114.3,37.48 111.71,37.48 111.25,37.94 111.25,38.45 X1.1 111.14,40.46 TP9.1
$3N63: length 2.1
  Top Layer w0.254: D5.1 105.12,32.2 R28.1
$3N129: length 22.8
  Top Layer w0.254: H9.1 97.79,3.7 100.94,6.85 R52.1 ; R52.1 102.49,7.64 R58.2 ; R52.1 R53.1 ; R59.2 v1(105.41,9.28)
  Bottom Layer w0.254: H9.1 97.79,3.82 103.24,9.28 v1(105.41,9.28)
$5N30: length 3.6
  Top Layer w0.254: 154.83,12.61 154.09,13.35 U20.11
$5N32: length 3.3
  Top Layer w0.254: U20.10 R7.1

## Copper pours and planes (outline as drawn; the poured copper is in the pictures)
+5V on Top Layer: 117.98,90.05 117.98,93.3 119.25,94.57 123,94.57 124.08,95.64 129.41,95.64 129.54,95.52 129.54,94.5 130.17,93.87 132.46,93.87 133.22,93.1 133.22,92.22 132.84,91.83 119.63,91.83 119.63,90.05
GND on Top Layer: 78.46,99 177.46,99 177.46,0 78.46,0
GND on Bottom Layer: 78.46,99 177.46,99 177.46,0 78.46,0
V3.3 on Top Layer: 96.29,9.13 96.08,8.93 95.26,8.93 96.28,9.94 96.29,9.94
V3.3 on Top Layer: 98.8,73.42 99.57,73.42 99.57,71.64 98.8,71.64
V3.3 on Top Layer: 130.55,94.37 130.43,94.5 130.43,95.52 130.55,95.64 134.11,95.64 135.51,97.04 138.43,97.04 138.68,96.79 138.68,90.31 138.1,89.73 134.9,89.73 134.9,93.46 133.98,94.37
V3.3 on Top Layer: 135.15,83.45 133.79,83.45 135.7,85.36 135.72,85.33 135.72,84.02
VIN on Top Layer: 113.79,97.29 113.79,94.88 113.66,94.75 113.01,94.69 111.84,91.88 112.33,91.39 114.48,91.39 114.8,91.06 114.8,89.55 114.55,89.29 112.52,89.29 110.92,90.89 102.81,90.89 102.74,90.82 102.74,90.69 102.82,90.61 102.82,89.72 103.37,89.17 103.37,87.52 103.25,87.39 102.61,87.39 102.23,87.01 102.23,85.74 102.11,85.86 100.45,85.86 99.95,85.36 99.95,82.05 100.2,81.8 102.36,81.8 102.49,81.67 102.49,80.28 101.72,79.52 100.07,79.52 98.8,80.78 98.8,91.2 99.41,91.2 103.86,95.64 111.27,95.64 112.92,97.29
PWM_5V on Top Layer: 112.14,86.12 116.58,86.12 116.71,85.99 116.71,84.21 116.58,84.09 112.27,84.09 111.94,83.77 111.94,82.78 111.35,82.19 108.2,82.19 107.95,81.94 107.95,80.66 107.82,80.53 106.55,80.53 106.42,80.66 106.17,80.66 106.17,83.58 107.69,85.1 111.12,85.1
PWM_5V on Top Layer: 106.82,80.78 106.82,84.42 111.45,84.42 111.63,84.59 111.63,85.39 112.38,86.13 116.44,86.13 116.58,85.99 116.58,83.58 115.44,82.44 108.45,82.44 108.2,82.18 108.2,81.04 107.95,80.78

Small or netless copper shapes (teardrops, artwork), in the pictures only: 675 on Top Layer, 100 on Bottom Layer

## Text on the board
Top Silkscreen Layer: 3V3 | SWCLK | SWDIO | TX | RX | GND | VCC | SCL | SDA | INT | CS | SCK | MISO | MOSI | 5V | boot按键 | 棕 | 红 | 黄 | 电源输入口 | 5V电源输出口 | 复位按键 | 电机2 | 电机1 | 电机3 | 电机4 | 电机5 | RK通讯串口 | 电机堵转检测开关 | I2C接口 | 打开时，ADC1-4禁用 | SPI接口 | 额外/眼睑连杆 | 下载口 | MSH调试串口 | 小拇指/眼睑连杆 | 大拇指/左眼 | 无名指/上下 | 中指/右眼 | 食指/上下 | 喇叭 | 麦克风 | 语音下载
